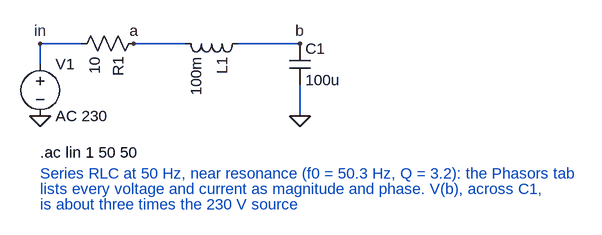
[diagram p0: schematic phasor_rlc.asc]
phasor_rlc.asc, the LTspice schematic file:
Version 4
SHEET 1 880 680
WIRE 0 96 0 64
WIRE 0 64 64 64
WIRE 144 64 224 64
WIRE 304 64 400 64
WIRE 400 128 400 176
FLAG 0 64 in
FLAG 144 64 a
FLAG 400 64 b
FLAG 0 176 0
FLAG 400 176 0
SYMBOL voltage 0 80 R0
SYMATTR InstName V1
SYMATTR Value AC 230
SYMBOL res 160 48 R90
SYMATTR InstName R1
SYMATTR Value 10
SYMBOL ind 320 48 R90
SYMATTR InstName L1
SYMATTR Value 100m
SYMBOL cap 384 64 R0
SYMATTR InstName C1
SYMATTR Value 100u
TEXT 0 232 Left 2 !.ac lin 1 50 50
TEXT 0 264 Left 2 ;Series RLC at 50 Hz, near resonance (f0 = 50.3 Hz, Q = 3.2): the Phasors tab
TEXT 0 288 Left 2 ;lists every voltage and current as magnitude and phase. V(b), across C1,
TEXT 0 312 Left 2 ;is about three times the 230 V source

The netlist it stands for:
* phasor_rlc.asc
V1 in 0 AC 230
R1 a in 10
L1 b a 100m
C1 b 0 100u
.ac lin 1 50 50
* Series RLC at 50 Hz, near resonance (f0 = 50.3 Hz, Q = 3.2): the Phasors tab
* lists every voltage and current as magnitude and phase. V(b), across C1,
* is about three times the 230 V source
.backanno
.end